# Altium project StarWars.PrjPcb
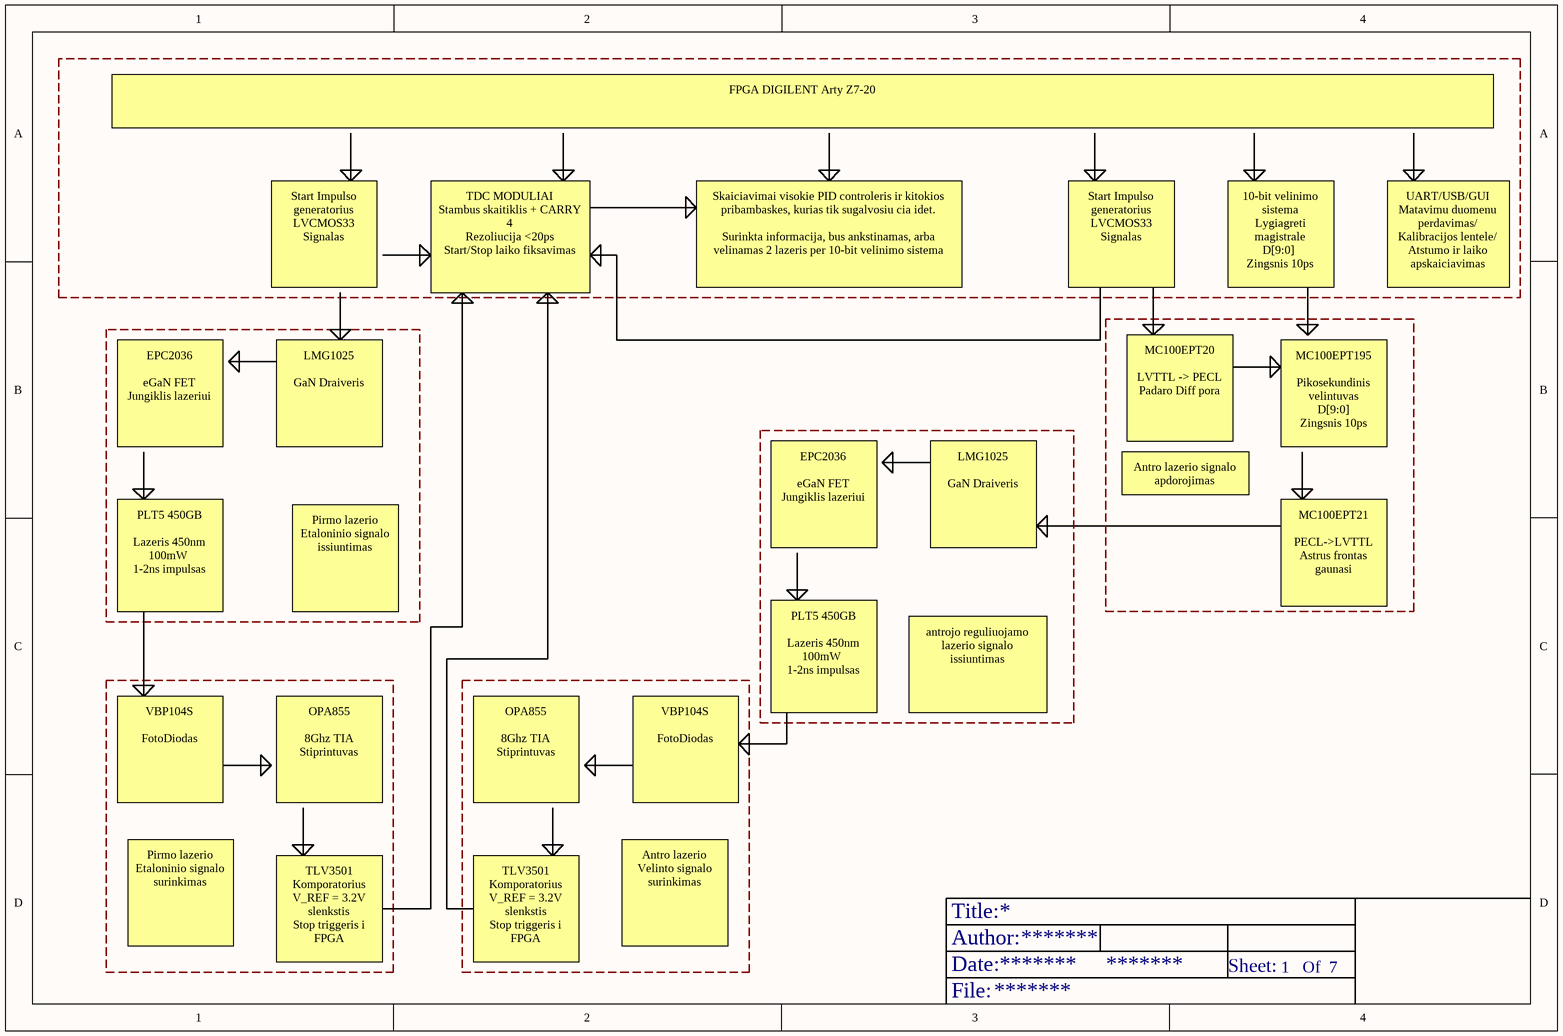
[diagram p0: Blokine diagrama.SchDoc]
7 sheets, 121 parts. Net scope: flat (ports and power ports of the same name join across sheets).
Board file: Prototype_REV1.PcbDoc
Sheets:
  Blokine diagrama.SchDoc
  Inputs_Outputs.SchDoc
  Power_Supply.SchDoc
  Time_Delay.SchDoc
  Laser_Driver.SchDoc
  Light_Detection.SchDoc
  Laser_System.SchDoc

## Sheet Blokine diagrama.SchDoc
size A4; Date: *******; ApprovedBy: *******; CheckedBy: None; Author: *******; CompanyName: *******; DrawnBy: Name; Engineer: *******; Organization: *******; Address1: *******; Address2: *******; Address3: *******; Address4: *******; DocumentNumber: Doc Num; Revision: *******; SheetNumber: 1; SheetTotal: 7; CurrentTime: *******; CurrentDate: *******; Time: *******; DocumentFullPathAndName: *******; DocumentName: *******; ModifiedDate: *******; ImagePath: *******; ProjectName: *******; Application_BuildNumber: *******

### Notes on the sheet
- FPGA DIGILENT Arty Z7-20
- Start Impulso generatorius
  LVCMOS33 Signalas
- TDC MODULIAI
  Stambus skaitiklis + CARRY 4
  Rezoliucija <20ps
  Start/Stop laiko fiksavimas
- Skaiciavimai visokie PID controleris ir kitokios pribambaskes, kurias tik sugalvosiu cia idet.
  Surinkta informacija, bus ankstinamas, arba velinamas 2 lazeris per 10-bit velinimo sistema
- 10-bit velinimo sistema
  Lygiagreti magistrale
  D[9:0]
  Zingsnis 10ps
- UART/USB/GUI
  Matavimu duomenu perdavimas/
  Kalibracijos lentele/
  Atstumo ir laiko apskaiciavimas
- EPC2036
  eGaN FET
  Jungiklis lazeriui
- LMG1025
  GaN Draiveris
- MC100EPT20
  LVTTL -> PECL
  Padaro Diff pora
- MC100EPT195
  Pikosekundinis velintuvas
  D[9:0]
  Zingsnis 10ps
- Antro lazerio signalo apdorojimas
- PLT5 450GB
  Lazeris 450nm
  100mW
  1-2ns impulsas
- Pirmo lazerio
  Etaloninio signalo issiuntimas
- MC100EPT21
  PECL->LVTTL
  Astrus frontas gaunasi
- antrojo reguliuojamo lazerio signalo issiuntimas
- VBP104S
  FotoDiodas
- OPA855
  8Ghz TIA Stiprintuvas
- Pirmo lazerio
  Etaloninio signalo surinkimas
- TLV3501
  Komporatorius
  V_REF = 3.2V slenkstis
  Stop triggeris i FPGA
- Antro lazerio
  Velinto signalo surinkimas
- Title:
- Date:
- Author:
- Sheet:
- Of
- File:

## Sheet Inputs_Outputs.SchDoc
size A4; Date: *******; ApprovedBy: *******; CheckedBy: None; Author: *******; CompanyName: *******; DrawnBy: Name; Engineer: *******; Organization: *******; Address1: *******; Address2: *******; Address3: *******; Address4: *******; DocumentNumber: Doc Num; Revision: *******; SheetNumber: 2; SheetTotal: 7; CurrentTime: *******; CurrentDate: *******; Time: *******; DocumentFullPathAndName: *******; DocumentName: *******; ModifiedDate: *******; ImagePath: *******; ProjectName: *******; Application_BuildNumber: *******
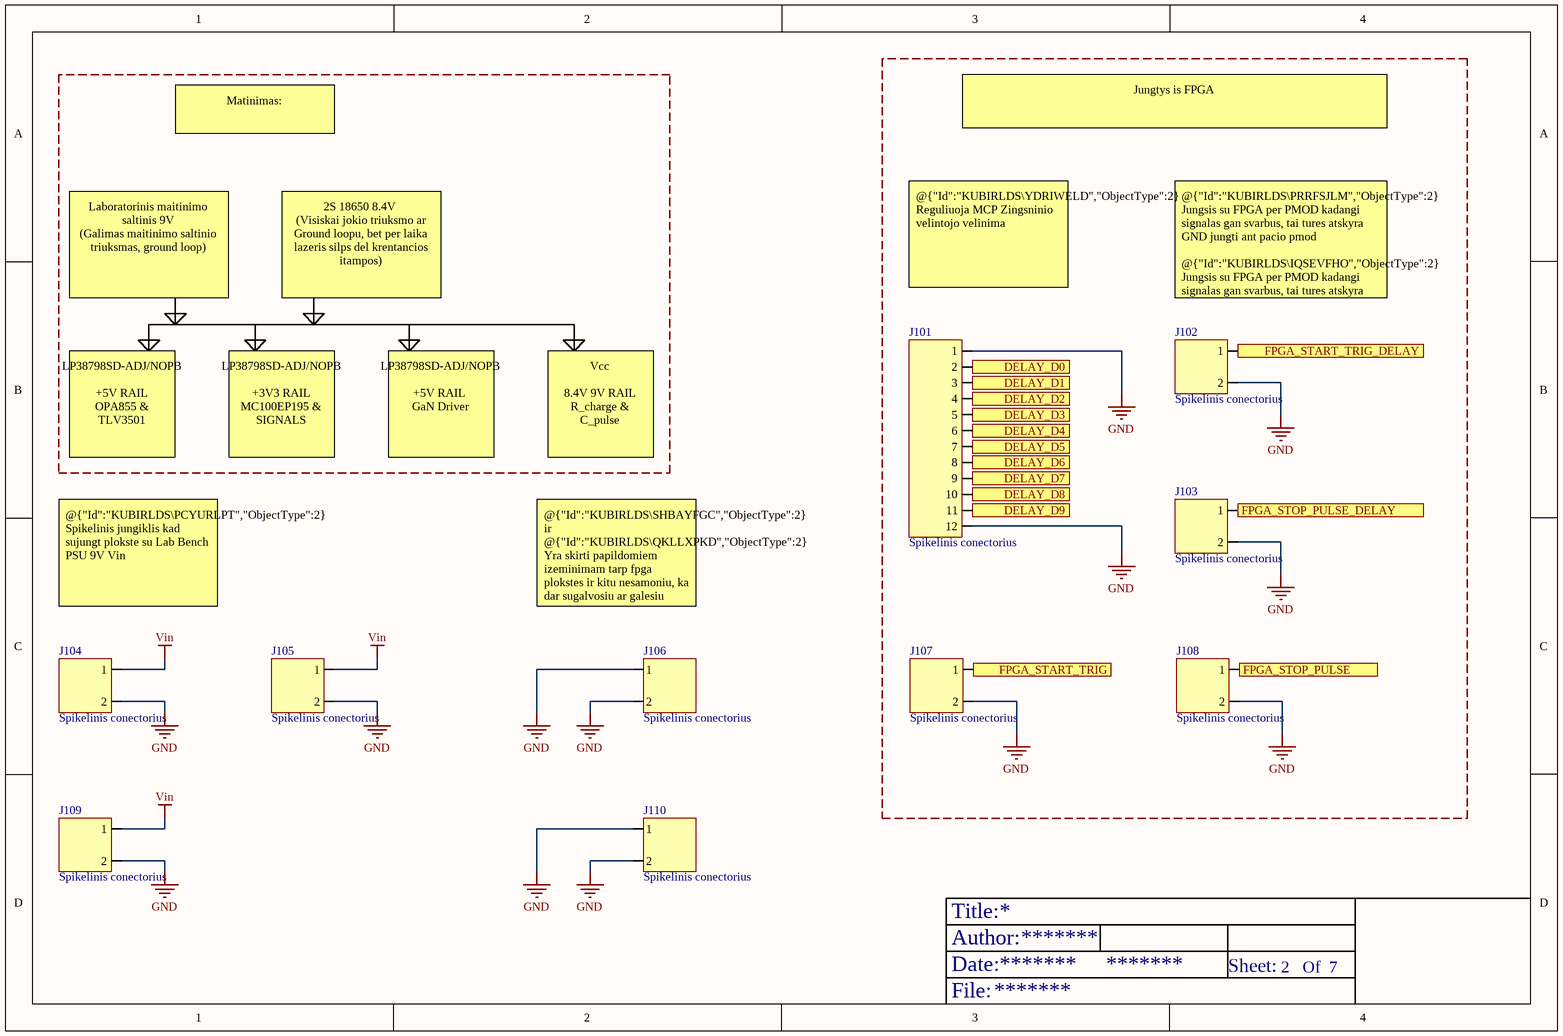
[diagram p1: Inputs_Outputs.SchDoc]

### Parts
J101  Spikelinis conectorius  [12pin header strip]
J102  Spikelinis conectorius  [2Pin header strip]
J103  Spikelinis conectorius  [2Pin header strip]
J104  Spikelinis conectorius  [2Pin header strip]
J105  Spikelinis conectorius  [2Pin header strip]
J106  Spikelinis conectorius  [2Pin header strip]
J107  Spikelinis conectorius  [2Pin header strip]
J108  Spikelinis conectorius  [2Pin header strip]
J109  Spikelinis conectorius  [2Pin header strip]
J110  Spikelinis conectorius  [2Pin header strip]

### Ports
DELAY_D0 (see Time_Delay[2B]), DELAY_D1 (see Time_Delay[2B]), DELAY_D2 (see Time_Delay[2B]), DELAY_D3 (see Time_Delay[2C]), DELAY_D4 (see Time_Delay[2C]), DELAY_D5 (see Time_Delay[2C]), DELAY_D6 (see Time_Delay[2C]), DELAY_D7 (see Time_Delay[2C]), DELAY_D8 (see Time_Delay[2C]), DELAY_D9 (see Time_Delay[2C]), FPGA_START_TRIG (see Laser_Driver[1C]), FPGA_START_TRIG_DELAY (see Time_Delay[1B]), FPGA_STOP_PULSE (see Light_Detection[4C]), FPGA_STOP_PULSE_DELAY (see Light_Detection[4B])

### Nets
GND: J101.1 J101.12 J102.2 J103.2 J104.2 J105.2 J106.1 J106.2 J107.2 J108.2 J109.2 J110.1 J110.2
Vin: J104.1 J105.1 J109.1
NetJ101_2: J101.2 ; port DELAY_D0
NetJ101_3: J101.3 ; port DELAY_D1
NetJ101_4: J101.4 ; port DELAY_D2
NetJ101_5: J101.5 ; port DELAY_D3
NetJ101_6: J101.6 ; port DELAY_D4
NetJ101_7: J101.7 ; port DELAY_D5
NetJ101_8: J101.8 ; port DELAY_D6
NetJ101_9: J101.9 ; port DELAY_D7
NetJ101_10: J101.10 ; port DELAY_D8
NetJ101_11: J101.11 ; port DELAY_D9
NetJ102_1: J102.1 ; port FPGA_START_TRIG_DELAY
NetJ103_1: J103.1 ; port FPGA_STOP_PULSE_DELAY
NetJ107_1: J107.1 ; port FPGA_START_TRIG
NetJ108_1: J108.1 ; port FPGA_STOP_PULSE

### Notes on the sheet
- Matinimas:
- Jungtys is FPGA
- Laboratorinis maitinimo saltinis 9V
  (Galimas maitinimo saltinio triuksmas, ground loop)
- 2S 18650 8.4V
  (Visiskai jokio triuksmo ar Ground loopu, bet per laika lazeris silps del krentancios itampos)
- @{"Id":"KUBIRLDS\YDRIWELD","ObjectType":2} Reguliuoja MCP Zingsninio velintojo velinima
- (near J102) @{"Id":"KUBIRLDS\PRRFSJLM","ObjectType":2} Jungsis su FPGA per PMOD kadangi signalas gan svarbus, tai tures atskyra GND jungti ant pacio pmod
  @{"Id":"KUBIRLDS\IQSEVFHO","ObjectType":2} Jungsis su FPGA per PMOD kadangi signalas gan svarbus, tai tures atskyra GND jungti ant pacio pmod
- LP38798SD-ADJ/NOPB
  +5V RAIL OPA855 & TLV3501
- LP38798SD-ADJ/NOPB
  +3V3 RAIL MC100EP195 & SIGNALS
- LP38798SD-ADJ/NOPB
  +5V RAIL
  GaN Driver
- Vcc
  8.4V 9V RAIL
  R_charge & C_pulse
- @{"Id":"KUBIRLDS\PCYURLPT","ObjectType":2} Spikelinis jungiklis kad sujungt plokste su Lab Bench PSU 9V Vin
- @{"Id":"KUBIRLDS\SHBAYFGC","ObjectType":2} ir @{"Id":"KUBIRLDS\QKLLXPKD","ObjectType":2} Yra skirti papildomiem izeminimam tarp fpga plokstes ir kitu nesamoniu, ka dar sugalvosiu ar galesiu izemint
- Title:
- Date:
- Author:
- Sheet:
- Of
- File:

### Library data of the parts
J101 = 12PinConnector: TSW-112-07-G-S
J102-J110 = 2PinConnector

## Sheet Power_Supply.SchDoc
size A4; Date: *******; ApprovedBy: *******; CheckedBy: None; Author: *******; CompanyName: *******; DrawnBy: Name; Engineer: *******; Organization: *******; Address1: *******; Address2: *******; Address3: *******; Address4: *******; DocumentNumber: Doc Num; Revision: *******; SheetNumber: 3; SheetTotal: 7; CurrentTime: *******; CurrentDate: *******; Time: *******; DocumentFullPathAndName: *******; DocumentName: *******; ModifiedDate: *******; ImagePath: *******; ProjectName: *******; Application_BuildNumber: *******
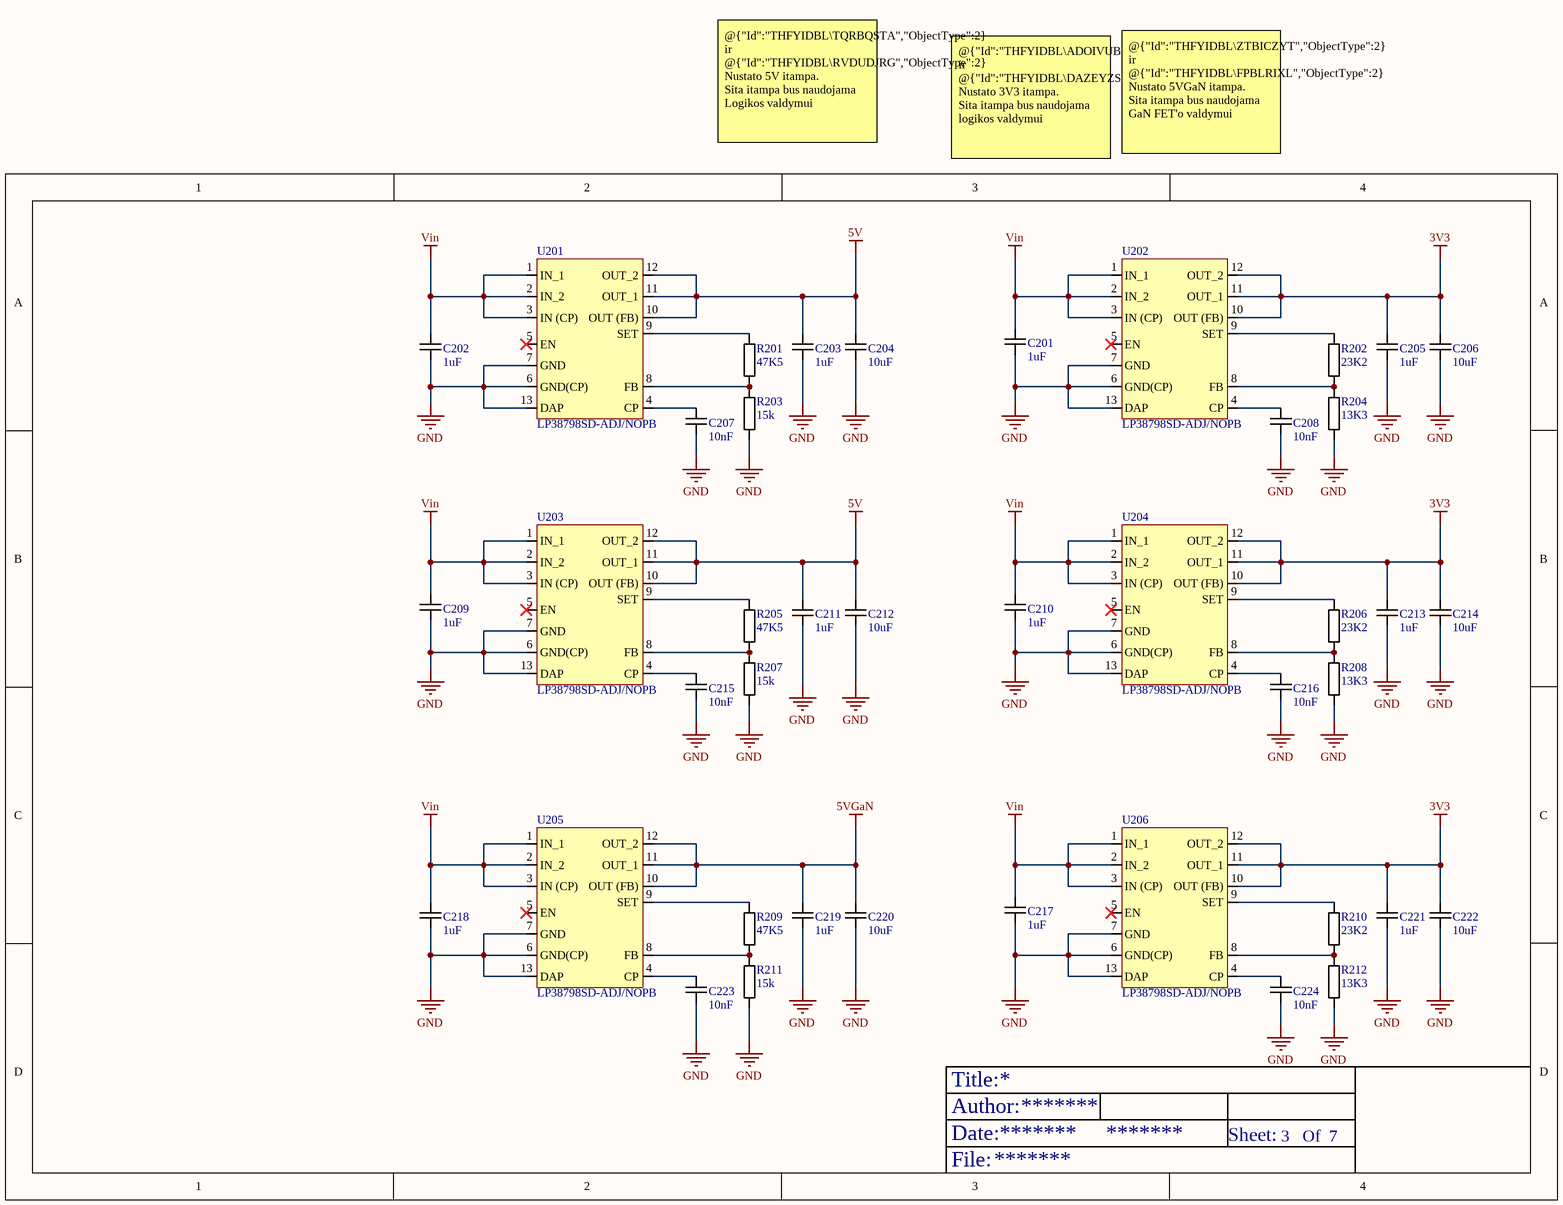
[diagram p2: Power_Supply.SchDoc]

### Parts
C201  1uF  [1uF 0603]
C202  1uF  [1uF 0603]
C203  1uF  [1uF 0603]
C204  10uF  [10uF 0805]
C205  1uF  [1uF 0603]
C206  10uF  [10uF 0805]
C207  10nF  [10nF 0402]
C208  10nF  [10nF 0402]
C209  1uF  [1uF 0603]
C210  1uF  [1uF 0603]
C211  1uF  [1uF 0603]
C212  10uF  [10uF 0805]
C213  1uF  [1uF 0603]
C214  10uF  [10uF 0805]
C215  10nF  [10nF 0402]
C216  10nF  [10nF 0402]
C217  1uF  [1uF 0603]
C218  1uF  [1uF 0603]
C219  1uF  [1uF 0603]
C220  10uF  [10uF 0805]
C221  1uF  [1uF 0603]
C222  10uF  [10uF 0805]
C223  10nF  [10nF 0402]
C224  10nF  [10nF 0402]
R201  47K5  [47.5k 0402]
R202  23K2  [23.2k 0402]
R203  15k  [15k 0402]
R204  13K3  [13k3 0402]
R205  47K5  [47.5k 0402]
R206  23K2  [23.2k 0402]
R207  15k  [15k 0402]
R208  13K3  [13k3 0402]
R209  47K5  [47.5k 0402]
R210  23K2  [23.2k 0402]
R211  15k  [15k 0402]
R212  13K3  [13k3 0402]
U201  LP38798SD-ADJ/NOPB  [LP38798SD-ADJ/NOPB]
U202  LP38798SD-ADJ/NOPB  [LP38798SD-ADJ/NOPB]
U203  LP38798SD-ADJ/NOPB  [LP38798SD-ADJ/NOPB]
U204  LP38798SD-ADJ/NOPB  [LP38798SD-ADJ/NOPB]
U205  LP38798SD-ADJ/NOPB  [LP38798SD-ADJ/NOPB]
U206  LP38798SD-ADJ/NOPB  [LP38798SD-ADJ/NOPB]

### Nets
3V3: C205.2 C206.2 C213.2 C214.2 C221.2 C222.2 U202.10(OUT_(FB)) U202.11(OUT_1) U202.12(OUT_2) U204.10(OUT_(FB)) U204.11(OUT_1) U204.12(OUT_2) U206.10(OUT_(FB)) U206.11(OUT_1) U206.12(OUT_2)
5V: C203.2 C204.2 C211.2 C212.2 U201.10(OUT_(FB)) U201.11(OUT_1) U201.12(OUT_2) U203.10(OUT_(FB)) U203.11(OUT_1) U203.12(OUT_2)
5VGaN: C219.2 C220.2 U205.10(OUT_(FB)) U205.11(OUT_1) U205.12(OUT_2)
GND: C201.1 C202.1 C203.1 C204.1 C205.1 C206.1 C207.1 C208.1 C209.1 C210.1 C211.1 C212.1 C213.1 C214.1 C215.1 C216.1 C217.1 C218.1 C219.1 C220.1 C221.1 C222.1 C223.1 C224.1 R203.1 R204.1 R207.1 R208.1 R211.1 R212.1 U201.6(GND(CP)) U201.7(GND) U201.13(DAP) U202.6(GND(CP)) U202.7(GND) U202.13(DAP) U203.6(GND(CP)) U203.7(GND) U203.13(DAP) U204.6(GND(CP)) U204.7(GND) U204.13(DAP) U205.6(GND(CP)) U205.7(GND) U205.13(DAP) U206.6(GND(CP)) U206.7(GND) U206.13(DAP)
Vin: C201.2 C202.2 C209.2 C210.2 C217.2 C218.2 U201.1(IN_1) U201.2(IN_2) U201.3(IN_(CP)) U202.1(IN_1) U202.2(IN_2) U202.3(IN_(CP)) U203.1(IN_1) U203.2(IN_2) U203.3(IN_(CP)) U204.1(IN_1) U204.2(IN_2) U204.3(IN_(CP)) U205.1(IN_1) U205.2(IN_2) U205.3(IN_(CP)) U206.1(IN_1) U206.2(IN_2) U206.3(IN_(CP))
NetC207_2: C207.2 U201.4(CP)
NetC208_2: C208.2 U202.4(CP)
NetC215_2: C215.2 U203.4(CP)
NetC216_2: C216.2 U204.4(CP)
NetC223_2: C223.2 U205.4(CP)
NetC224_2: C224.2 U206.4(CP)
NetR201_1: R201.1 R203.2 U201.8(FB)
NetR201_2: R201.2 U201.9(SET)
NetR202_1: R202.1 U202.9(SET)
NetR202_2: R202.2 R204.2 U202.8(FB)
NetR205_1: R205.1 R207.2 U203.8(FB)
NetR205_2: R205.2 U203.9(SET)
NetR206_1: R206.1 U204.9(SET)
NetR206_2: R206.2 R208.2 U204.8(FB)
NetR209_1: R209.1 R211.2 U205.8(FB)
NetR209_2: R209.2 U205.9(SET)
NetR210_1: R210.1 U206.9(SET)
NetR210_2: R210.2 R212.2 U206.8(FB)

Not connected (* = marked no-connect by the designer): U201 5(EN)*; U202 5(EN)*; U203 5(EN)*; U204 5(EN)*; U205 5(EN)*; U206 5(EN)*

### Notes on the sheet
- @{"Id":"THFYIDBL\TQRBQSTA","ObjectType":2} ir @{"Id":"THFYIDBL\RVDUDJRG","ObjectType":2} Nustato 5V itampa.
  Sita itampa bus naudojama Logikos valdymui
- @{"Id":"THFYIDBL\ZTBICZYT","ObjectType":2} ir @{"Id":"THFYIDBL\FPBLRIXL","ObjectType":2} Nustato 5VGaN itampa.
  Sita itampa bus naudojama GaN FET'o valdymui
- @{"Id":"THFYIDBL\ADOIVUBA","ObjectType":2} ir @{"Id":"THFYIDBL\DAZEYZSS","ObjectType":2} Nustato 3V3 itampa.
  Sita itampa bus naudojama logikos valdymui
- Title:
- Date:
- Author:
- Sheet:
- Of
- File:

### Library data of the parts
C201-C203 C205 C209-C211 C213 C217-C219 C221 = 1uF 0603: CGA3E1X7R1E105K080AC
C204 C206 C212 C214 C220 C222 = 10uF 0805: GRJ21BR61E106KE01K
C207 C208 C215 C216 C223 C224 = 10nF 0402: C0402C103J5RACTU
R201 R205 R209 = 47K5 0402: CR0402-FX-4752GLF
R202 R206 R210 = 23K2 0402: CR0402-FX-2322GLF
R203 R207 R211 = 15k 0402: CRCW040215K0FKED
R204 R208 R212 = 13K3 0402: CRCW040213K3FKED
U201-U206 = LP38798SD-ADJ/NOPB: input 3-20V output 1.5-5V

## Sheet Time_Delay.SchDoc
size A4; Date: *******; ApprovedBy: *******; CheckedBy: None; Author: *******; CompanyName: *******; DrawnBy: Name; Engineer: *******; Organization: *******; Address1: *******; Address2: *******; Address3: *******; Address4: *******; DocumentNumber: Doc Num; Revision: *******; SheetNumber: 4; SheetTotal: 7; CurrentTime: *******; CurrentDate: *******; Time: *******; DocumentFullPathAndName: *******; DocumentName: *******; ModifiedDate: *******; ImagePath: *******; ProjectName: *******; Application_BuildNumber: *******
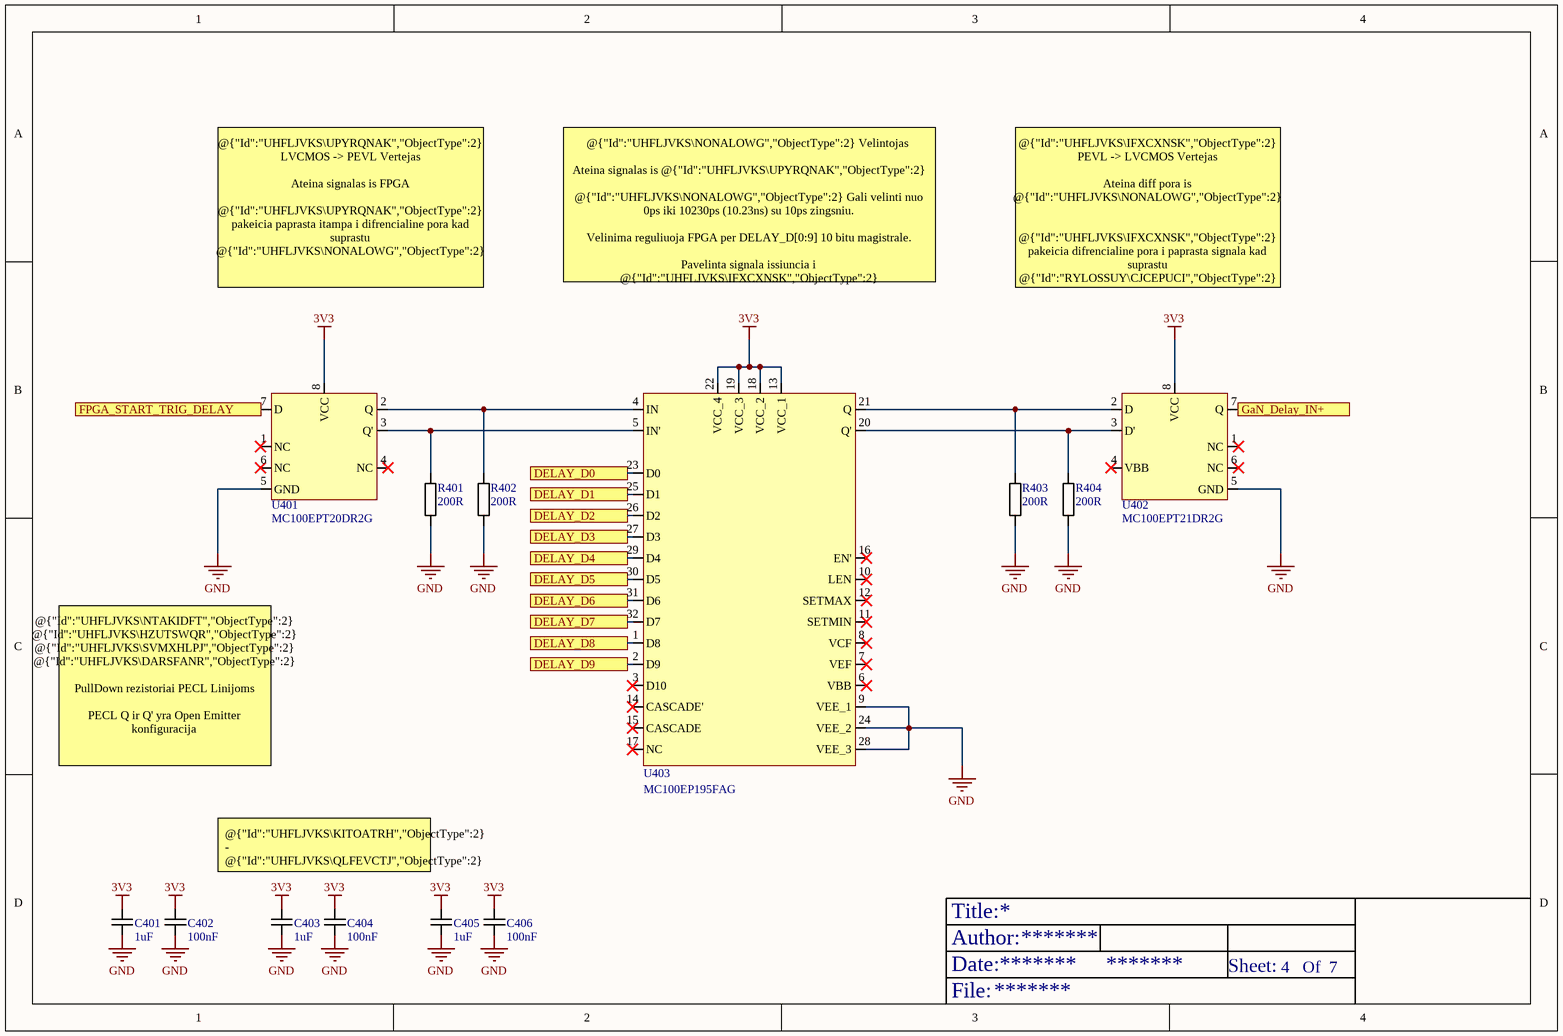
[diagram p3: Time_Delay.SchDoc]

### Parts
C401  1uF  [1uF 0603]
C402  100nF  [100nF 0402]
C403  1uF  [1uF 0603]
C404  100nF  [100nF 0402]
C405  1uF  [1uF 0603]
C406  100nF  [100nF 0402]
R401  200R  [200R 0402]
R402  200R  [200R 0402]
R403  200R  [200R 0402]
R404  200R  [200R 0402]
U401  MC100EPT20DR2G  [MC100EPT20DR2G]
U402  MC100EPT21DR2G  [MC100EPT21DR2G]
U403  MC100EP195FAG  [MC100EP195FAG]

### Ports
DELAY_D0 (see Inputs_Outputs[3B]), DELAY_D1 (see Inputs_Outputs[3B]), DELAY_D2 (see Inputs_Outputs[3B]), DELAY_D3 (see Inputs_Outputs[3B]), DELAY_D4 (see Inputs_Outputs[3B]), DELAY_D5 (see Inputs_Outputs[3B]), DELAY_D6 (see Inputs_Outputs[3B]), DELAY_D7 (see Inputs_Outputs[3B]), DELAY_D8 (see Inputs_Outputs[3B]), DELAY_D9 (see Inputs_Outputs[3B]), FPGA_START_TRIG_DELAY (see Inputs_Outputs[4B]), GaN_Delay_IN+ (see Laser_Driver[1B])

### Nets
3V3: C401.2 C402.2 C403.2 C404.2 C405.2 C406.2 U401.8(VCC) U402.8(VCC) U403.13(VCC_1) U403.18(VCC_2) U403.19(VCC_3) U403.22(VCC_4)
GND: C401.1 C402.1 C403.1 C404.1 C405.1 C406.1 R401.1 R402.1 R403.1 R404.1 U401.5(GND) U402.5(GND) U403.9(VEE_1) U403.24(VEE_2) U403.28(VEE_3)
NetJ101_2: U403.23(D0) ; port DELAY_D0
NetJ101_3: U403.25(D1) ; port DELAY_D1
NetJ101_4: U403.26(D2) ; port DELAY_D2
NetJ101_5: U403.27(D3) ; port DELAY_D3
NetJ101_6: U403.29(D4) ; port DELAY_D4
NetJ101_7: U403.30(D5) ; port DELAY_D5
NetJ101_8: U403.31(D6) ; port DELAY_D6
NetJ101_9: U403.32(D7) ; port DELAY_D7
NetJ101_10: U403.1(D8) ; port DELAY_D8
NetJ101_11: U403.2(D9) ; port DELAY_D9
NetJ102_1: U401.7(D) ; port FPGA_START_TRIG_DELAY
NetR302_2: U402.7(Q) ; port GaN_Delay_IN+
NetR401_2: R401.2 U401.3(Q') U403.5(IN')
NetR402_2: R402.2 U401.2(Q) U403.4(IN)
NetR403_2: R403.2 U402.2(D) U403.21(Q)
NetR404_2: R404.2 U402.3(D') U403.20(Q')

Not connected (* = marked no-connect by the designer): U401 1(NC)* 4(NC)* 6(NC)*; U402 1(NC)* 4(VBB)* 6(NC)*; U403 3(D10)* 6(VBB)* 7(VEF)* 8(VCF)* 10(LEN)* 11(SETMIN)* 12(SETMAX)* 14(CASCADE')* 15(CASCADE)* 16(EN')* 17(NC)*

### Notes on the sheet
- @{"Id":"UHFLJVKS\UPYRQNAK","ObjectType":2} LVCMOS -> PEVL Vertejas
  Ateina signalas is FPGA
  @{"Id":"UHFLJVKS\UPYRQNAK","ObjectType":2} pakeicia paprasta itampa i difrencialine pora kad suprastu @{"Id":"UHFLJVKS\NONALOWG","ObjectType":2}
- @{"Id":"UHFLJVKS\NONALOWG","ObjectType":2} Velintojas
  Ateina signalas is @{"Id":"UHFLJVKS\UPYRQNAK","ObjectType":2}
  @{"Id":"UHFLJVKS\NONALOWG","ObjectType":2} Gali velinti nuo 0ps iki 10230ps (10.23ns) su 10ps zingsniu.
  Velinima reguliuoja FPGA per DELAY_D[0:9] 10 bitu magistrale.
  Pavelinta signala issiuncia i @{"Id":"UHFLJVKS\IFXCXNSK","ObjectType":2}
- @{"Id":"UHFLJVKS\IFXCXNSK","ObjectType":2} PEVL -> LVCMOS Vertejas
  Ateina diff pora is @{"Id":"UHFLJVKS\NONALOWG","ObjectType":2}
  @{"Id":"UHFLJVKS\IFXCXNSK","ObjectType":2} pakeicia difrencialine pora i paprasta signala kad suprastu @{"Id":"RYLOSSUY\CJCEPUCI","ObjectType":2}
- @{"Id":"UHFLJVKS\NTAKIDFT","ObjectType":2} @{"Id":"UHFLJVKS\HZUTSWQR","ObjectType":2} @{"Id":"UHFLJVKS\SVMXHLPJ","ObjectType":2} @{"Id":"UHFLJVKS\DARSFANR","ObjectType":2}
  PullDown rezistoriai PECL Linijoms
  PECL Q ir Q' yra Open Emitter konfiguracija
- @{"Id":"UHFLJVKS\KITOATRH","ObjectType":2} - @{"Id":"UHFLJVKS\QLFEVCTJ","ObjectType":2}
  Bus prie @{"Id":"UHFLJVKS\UPYRQNAK","ObjectType":2} - @{"Id":"UHFLJVKS\NONALOWG","ObjectType":2} Iejimu
- Title:
- Date:
- Author:
- Sheet:
- Of
- File:

### Library data of the parts
C401 C403 C405 = 1uF 0603: CGA3E1X7R1E105K080AC
C402 C404 C406 = 100n 0402: C1005X7R1E104K050BB
R401-R404 = 200R 0402: ERA-2AED201X

## Sheet Laser_Driver.SchDoc
size A4; Date: *******; ApprovedBy: *******; CheckedBy: None; Author: *******; CompanyName: *******; DrawnBy: Name; Engineer: *******; Organization: *******; Address1: *******; Address2: *******; Address3: *******; Address4: *******; DocumentNumber: Doc Num; Revision: *******; SheetNumber: 5; SheetTotal: 7; CurrentTime: *******; CurrentDate: *******; Time: *******; DocumentFullPathAndName: *******; DocumentName: *******; ModifiedDate: *******; ImagePath: *******; ProjectName: *******; Application_BuildNumber: *******
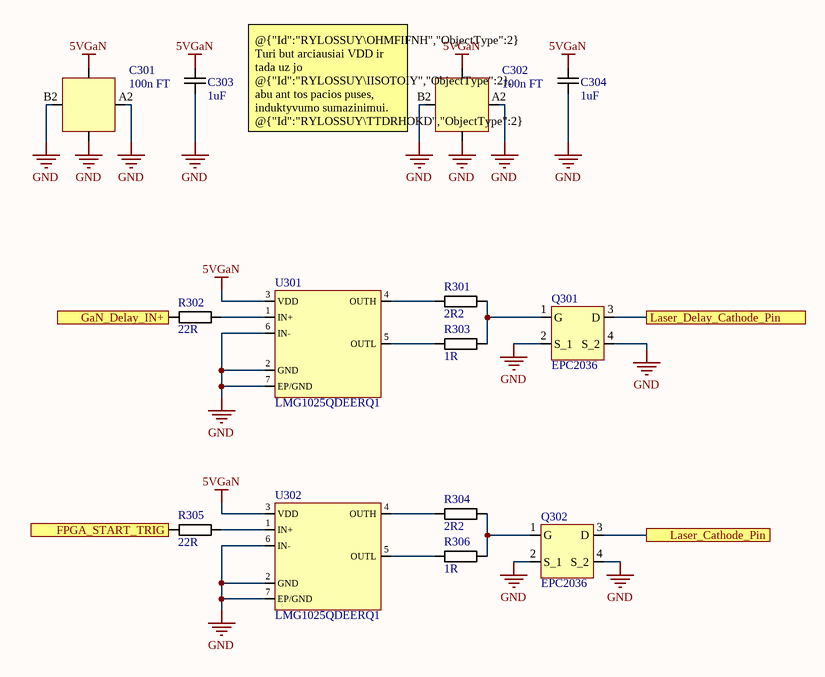
[diagram p4: Laser_Driver.SchDoc]

### Parts
C301  100n FT  [100n FT 0603]
C302  100n FT  [100n FT 0603]
C303  1uF  [1uF 0603]
C304  1uF  [1uF 0603]
Q301  EPC2036  [EPC2036]
Q302  EPC2036  [EPC2036]
R301  2R2  [2R2 0402]
R302  22R  [22R 0402]
R303  1R  [1R 0402]
R304  2R2  [2R2 0402]
R305  22R  [22R 0402]
R306  1R  [1R 0402]
U301  LMG1025QDEERQ1  [LMG1025QDEERQ1]
U302  LMG1025QDEERQ1  [LMG1025QDEERQ1]

### Ports
FPGA_START_TRIG (see Inputs_Outputs[3C]), GaN_Delay_IN+ (see Time_Delay[4B]), Laser_Cathode_Pin (see Laser_System[1C]), Laser_Delay_Cathode_Pin (see Laser_System[1B])

### Nets
5VGaN: C301.3(OUTPUT) C302.3(OUTPUT) C303.2 C304.2 U301.3(VDD) U302.3(VDD)
GND: C301.1(INPUT) C301.A2(GND_1) C301.B2(GND_2) C302.1(INPUT) C302.A2(GND_1) C302.B2(GND_2) C303.1 C304.1 Q301.2(S_1) Q301.4(S_2) Q302.2(S_1) Q302.4(S_2) U301.2(GND) U301.6(IN-) U301.7(EP/GND) U302.2(GND) U302.6(IN-) U302.7(EP/GND)
NetD601_3: Q301.3(D) ; port Laser_Delay_Cathode_Pin
NetD603_3: Q302.3(D) ; port Laser_Cathode_Pin
NetJ107_1: R305.2 ; port FPGA_START_TRIG
NetQ301_1: Q301.1(G) R301.2 R303.2
NetQ302_1: Q302.1(G) R304.2 R306.2
NetR301_1: R301.1 U301.4(OUTH)
NetR302_1: R302.1 U301.1(IN+)
NetR302_2: R302.2 ; port GaN_Delay_IN+
NetR303_1: R303.1 U301.5(OUTL)
NetR304_1: R304.1 U302.4(OUTH)
NetR305_1: R305.1 U302.1(IN+)
NetR306_1: R306.1 U302.5(OUTL)

### Notes on the sheet
- (near C302) @{"Id":"RYLOSSUY\OHMFIFNH","ObjectType":2} Turi but arciausiai VDD ir tada uz jo @{"Id":"RYLOSSUY\IISOTOIY","ObjectType":2}, abu ant tos pacios puses, induktyvumo sumazinimui.
  @{"Id":"RYLOSSUY\TTDRHOKD","ObjectType":2} Slopina visokius nepageidaujemus signalus
- Title:
- Date:
- Author:
- Sheet:
- Of
- File:

### Library data of the parts
C301 C302 = 100n 0603 FT: NFM18PC104R1C3D
C303 C304 = 1uF 0603: CGA3E1X7R1E105K080AC
R301 R304 = 2R2 0402: CRT0402-FZ-2R00GLF
R302 R305 = 22R 0402: ERA-2AKD220X
R303 R306 = 1R 0402: CRT0402-FZ-1R00GLF
U301 U302 = LMG1025QDEERQ1: GaN Driver

## Sheet Light_Detection.SchDoc
size A4; Date: *******; ApprovedBy: *******; CheckedBy: None; Author: *******; CompanyName: *******; DrawnBy: Name; Engineer: *******; Organization: *******; Address1: *******; Address2: *******; Address3: *******; Address4: *******; DocumentNumber: Doc Num; Revision: *******; SheetNumber: 6; SheetTotal: 7; CurrentTime: *******; CurrentDate: *******; Time: *******; DocumentFullPathAndName: *******; DocumentName: *******; ModifiedDate: *******; ImagePath: *******; ProjectName: *******; Application_BuildNumber: *******
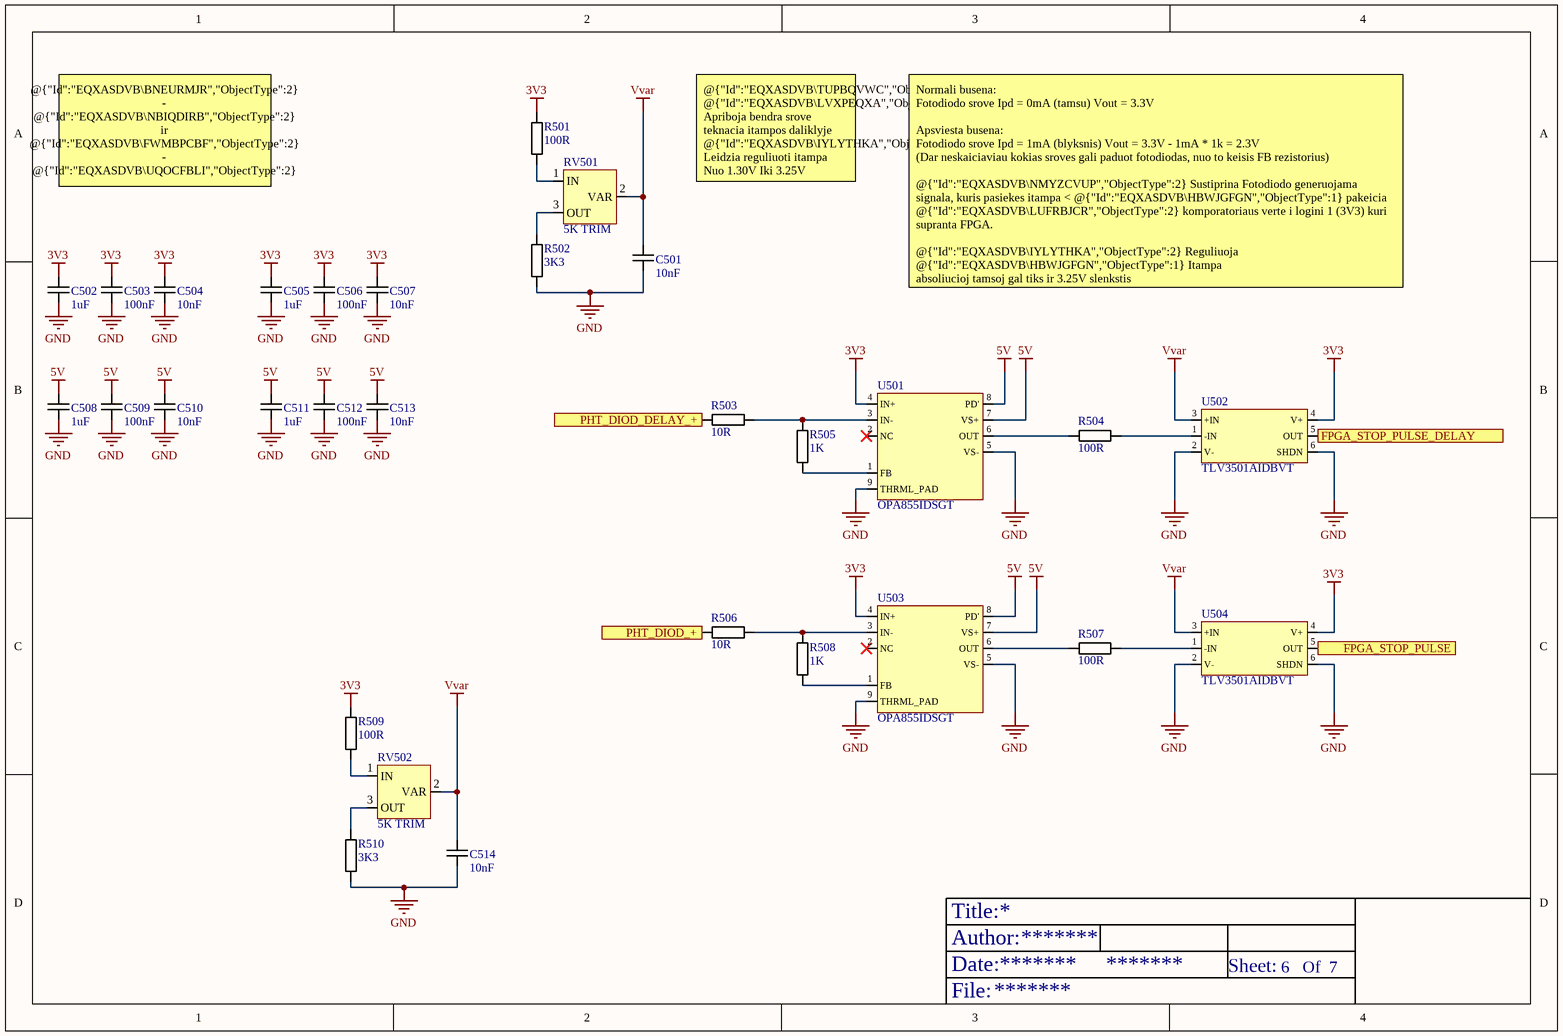
[diagram p5: Light_Detection.SchDoc]

### Parts
C501  10nF  [10nF 0402]
C502  1uF  [1uF 0603]
C503  100nF  [100nF 0402]
C504  10nF  [10nF 0402]
C505  1uF  [1uF 0603]
C506  100nF  [100nF 0402]
C507  10nF  [10nF 0402]
C508  1uF  [1uF 0603]
C509  100nF  [100nF 0402]
C510  10nF  [10nF 0402]
C511  1uF  [1uF 0603]
C512  100nF  [100nF 0402]
C513  10nF  [10nF 0402]
C514  10nF  [10nF 0402]
R501  100R  [100R 0402]
R502  3K3  [3k3 0402]
R503  10R  [10R 0402]
R504  100R  [100R 0402]
R505  1K  [1k 0603]
R506  10R  [10R 0402]
R507  100R  [100R 0402]
R508  1K  [1k 0603]
R509  100R  [100R 0402]
R510  3K3  [3k3 0402]
RV501  5K TRIM  [5K TRIM]
RV502  5K TRIM  [5K TRIM]
U501  OPA855IDSGT  [OPA855IDSGT]
U502  TLV3501AIDBVT  [TLV3501AIDBVT]
U503  OPA855IDSGT  [OPA855IDSGT]
U504  TLV3501AIDBVT  [TLV3501AIDBVT]

### Ports
FPGA_STOP_PULSE (see Inputs_Outputs[4C]), FPGA_STOP_PULSE_DELAY (see Inputs_Outputs[4B]), PHT_DIOD_+ (see Laser_System[3C]), PHT_DIOD_DELAY_+ (see Laser_System[3B])

### Nets
3V3: C502.2 C503.2 C504.2 C505.2 C506.2 C507.2 R501.1 R509.1 U501.4(IN+) U502.4(V+) U503.4(IN+) U504.4(V+)
5V: C508.2 C509.2 C510.2 C511.2 C512.2 C513.2 U501.7(VS+) U501.8(PD') U503.7(VS+) U503.8(PD')
GND: C501.1 C502.1 C503.1 C504.1 C505.1 C506.1 C507.1 C508.1 C509.1 C510.1 C511.1 C512.1 C513.1 C514.1 R502.2 R510.2 U501.5(VS-) U501.9(THRML_PAD) U502.2(V-) U502.6(SHDN) U503.5(VS-) U503.9(THRML_PAD) U504.2(V-) U504.6(SHDN)
Vvar: C501.2 C514.2 RV501.2(VAR) RV502.2(VAR) U502.3(+IN) U504.3(+IN)
NetD602_1: R503.1 ; port PHT_DIOD_DELAY_+
NetD604_1: R506.1 ; port PHT_DIOD_+
NetJ103_1: U502.5(OUT) ; port FPGA_STOP_PULSE_DELAY
NetJ108_1: U504.5(OUT) ; port FPGA_STOP_PULSE
NetR501_2: R501.2 RV501.1(IN)
NetR502_1: R502.1 RV501.3(OUT)
NetR503_2: R503.2 R505.1 U501.3(IN-)
NetR504_1: R504.1 U501.6(OUT)
NetR504_2: R504.2 U502.1(-IN)
NetR505_2: R505.2 U501.1(FB)
NetR506_2: R506.2 R508.1 U503.3(IN-)
NetR507_1: R507.1 U503.6(OUT)
NetR507_2: R507.2 U504.1(-IN)
NetR508_2: R508.2 U503.1(FB)
NetR509_2: R509.2 RV502.1(IN)
NetR510_1: R510.1 RV502.3(OUT)

Not connected (* = marked no-connect by the designer): U501 2(NC)*; U503 2(NC)*

### Notes on the sheet
- @{"Id":"EQXASDVB\BNEURMJR","ObjectType":2} - @{"Id":"EQXASDVB\NBIQDIRB","ObjectType":2} ir @{"Id":"EQXASDVB\FWMBPCBF","ObjectType":2} - @{"Id":"EQXASDVB\UQOCFBLI","ObjectType":2}
  Reikalingi filtravimui, bei stabilios itampos islaikymui.
  Kiekviena eile kondensatoriu lituojasi kuo arciau mikruskes
  @{"Id":"EQXASDVB\NMYZCVUP","ObjectType":2} - @{"Id":"EQXASDVB\AOQOIBQK","ObjectType":2}
- @{"Id":"EQXASDVB\TUPBQVWC","ObjectType":2} @{"Id":"EQXASDVB\LVXPEQXA","ObjectType":2} Apriboja bendra srove teknacia itampos daliklyje
  @{"Id":"EQXASDVB\IYLYTHKA","ObjectType":2} Leidzia reguliuoti itampa
  Nuo 1.30V Iki 3.25V
- Normali busena:
  Fotodiodo srove Ipd = 0mA (tamsu) Vout = 3.3V
  Apsviesta busena:
  Fotodiodo srove Ipd = 1mA (blyksnis) Vout = 3.3V - 1mA * 1k = 2.3V
  (Dar neskaiciaviau kokias sroves gali paduot fotodiodas, nuo to keisis FB rezistorius)
  @{"Id":"EQXASDVB\NMYZCVUP","ObjectType":2} Sustiprina Fotodiodo generuojama signala, kuris pasiekes itampa < @{"Id":"EQXASDVB\HBWJGFGN","ObjectType":1} pakeicia @{"Id":"EQXASDVB\LUFRBJCR","ObjectType":2} komporatoriaus verte i logini 1 (3V3) kuri supranta FPGA.
  @{"Id":"EQXASDVB\IYLYTHKA","ObjectType":2} Reguliuoja @{"Id":"EQXASDVB\HBWJGFGN","ObjectType":1} Itampa
  absoliucioj tamsoj gal tiks ir 3.25V slenkstis
  Apsviestam kambari gali but reikes ir 1.30V slenkscio
- Title:
- Date:
- Author:
- Sheet:
- Of
- File:

### Library data of the parts
C501 C504 C507 C510 C513 C514 = 10nF 0402: C0402C103J5RACTU
C502 C505 C508 C511 = 1uF 0603: CGA3E1X7R1E105K080AC
C503 C506 C509 C512 = 100n 0402: C1005X7R1E104K050BB
R501 R504 R507 R509 = 100R 0402: ERA-2VEB1000X
R502 R510 = 3K3 0402: ERJ-U02F3301X
R503 R506 = 10R 0402: CRT0402-DZ-10R0GLF
R505 R508 = 1K 0603: ERA-3AEB102V
RV501 RV502 = 5K TRIM: 3314G-1-502E
U501 U503 = OPA855IDSGT: OP ampas
U502 U504 = TLV3501AIDBVT: Comparatorius

## Sheet Laser_System.SchDoc
size A4; Date: *******; ApprovedBy: *******; CheckedBy: None; Author: *******; CompanyName: *******; DrawnBy: Name; Engineer: *******; Organization: *******; Address1: *******; Address2: *******; Address3: *******; Address4: *******; DocumentNumber: Doc Num; Revision: *******; SheetNumber: 7; SheetTotal: 7; CurrentTime: *******; CurrentDate: *******; Time: *******; DocumentFullPathAndName: *******; DocumentName: *******; ModifiedDate: *******; ImagePath: *******; ProjectName: *******; Application_BuildNumber: *******
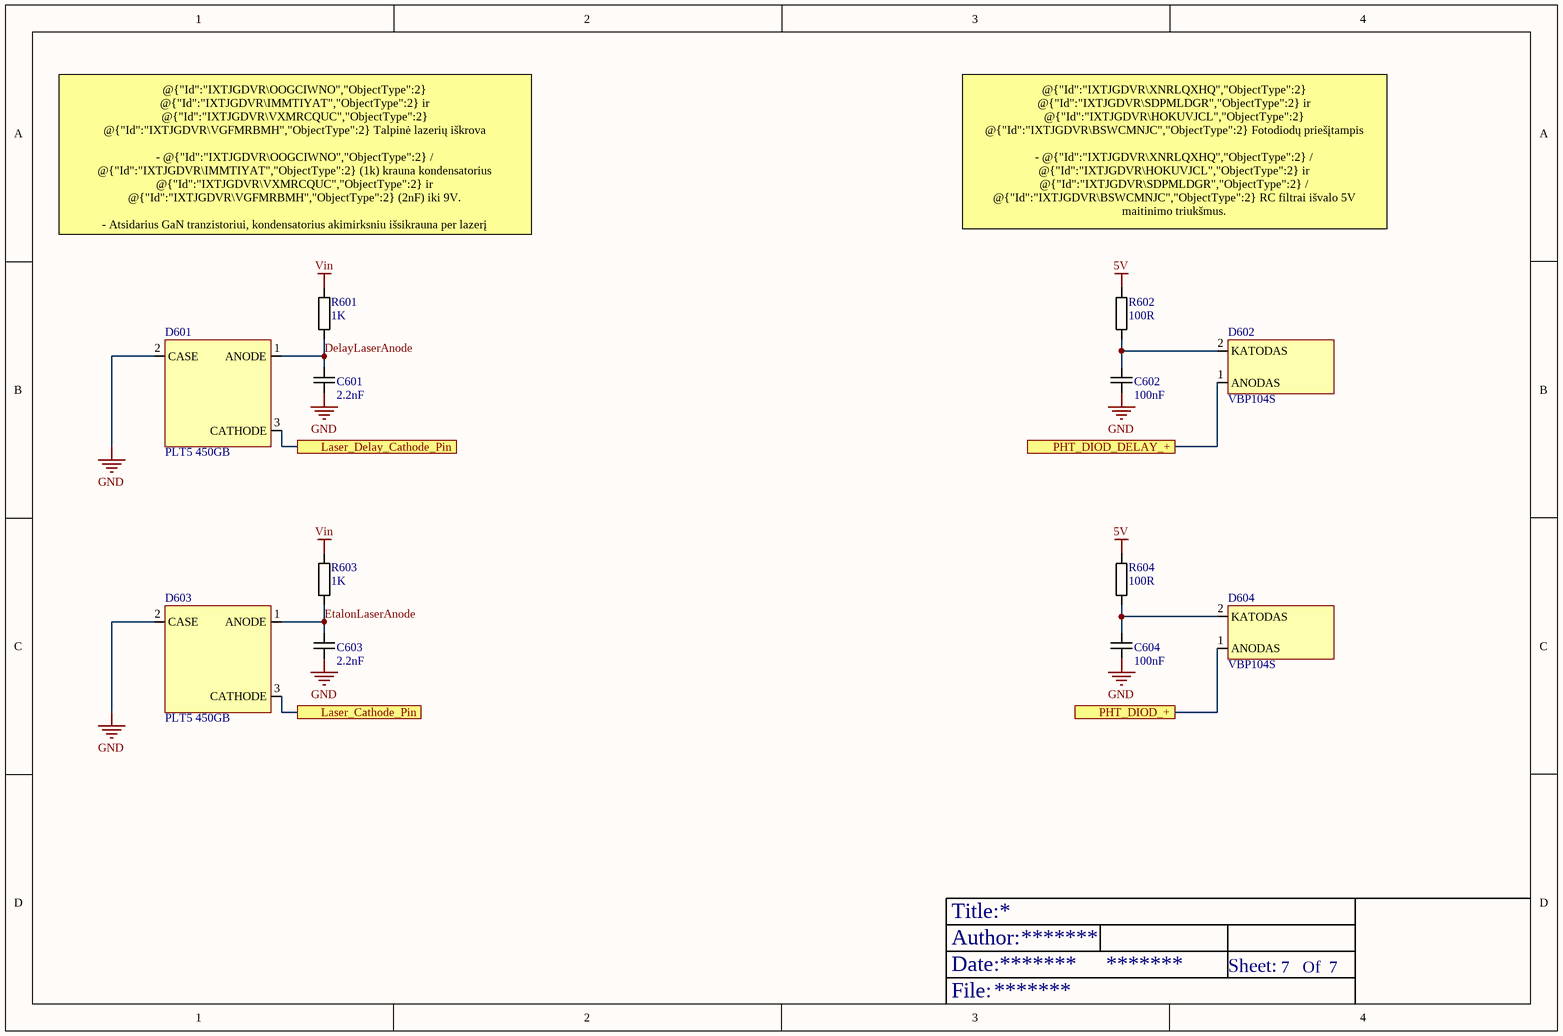
[diagram p6: Laser_System.SchDoc]

### Parts
C601  2.2nF  [2.2nF 0603]
C602  100nF  [100nF 0402]
C603  2.2nF  [2.2nF 0603]
C604  100nF  [100nF 0402]
D601  PLT5 450GB  [PLT5 450GB]
D602  VBP104S  [VBP104S]
D603  PLT5 450GB  [PLT5 450GB]
D604  VBP104S  [VBP104S]
R601  1K  [1k 0603]
R602  100R  [100R 0402]
R603  1K  [1k 0603]
R604  100R  [100R 0402]

### Ports
Laser_Cathode_Pin (see Laser_Driver[2C]), Laser_Delay_Cathode_Pin (see Laser_Driver[2B]), PHT_DIOD_+ (see Light_Detection[2C]), PHT_DIOD_DELAY_+ (see Light_Detection[2B])

### Nets
5V: R602.1 R604.2
GND: C601.1 C602.1 C603.1 C604.1 D601.2(CASE) D603.2(CASE)
Vin: R601.2 R603.2
DelayLaserAnode: C601.2 D601.1(ANODE) R601.1
EtalonLaserAnode: C603.2 D603.1(ANODE) R603.1
NetC602_2: C602.2 D602.2(KATODAS) R602.2
NetC604_2: C604.2 D604.2(KATODAS) R604.1
NetD601_3: D601.3(CATHODE) ; port Laser_Delay_Cathode_Pin
NetD602_1: D602.1(ANODAS) ; port PHT_DIOD_DELAY_+
NetD603_3: D603.3(CATHODE) ; port Laser_Cathode_Pin
NetD604_1: D604.1(ANODAS) ; port PHT_DIOD_+

### Notes on the sheet
- @{"Id":"IXTJGDVR\OOGCIWNO","ObjectType":2} @{"Id":"IXTJGDVR\IMMTIYAT","ObjectType":2} ir @{"Id":"IXTJGDVR\VXMRCQUC","ObjectType":2} @{"Id":"IXTJGDVR\VGFMRBMH","ObjectType":2} Talpinė lazerių iškrova
  - @{"Id":"IXTJGDVR\OOGCIWNO","ObjectType":2} / @{"Id":"IXTJGDVR\IMMTIYAT","ObjectType":2} (1k) krauna kondensatorius @{"Id":"IXTJGDVR\VXMRCQUC","ObjectType":2} ir @{"Id":"IXTJGDVR\VGFMRBMH","ObjectType":2} (2nF) iki 9V.
  - Atsidarius GaN tranzistoriui, kondensatorius akimirksniu išsikrauna per lazerį
  ( @{"Id":"IXTJGDVR\VURCQILD","ObjectType":2} / @{"Id":"IXTJGDVR\NUGRJXVH","ObjectType":2} ) į žemę ir duoda aštrų sub-ns šviesos impulsą.
  - Kondensatoriui išsikrovus lazeris užgęsta pats, o 1k varža apsaugo jį nuo sudegimo.
- @{"Id":"IXTJGDVR\XNRLQXHQ","ObjectType":2} @{"Id":"IXTJGDVR\SDPMLDGR","ObjectType":2} ir @{"Id":"IXTJGDVR\HOKUVJCL","ObjectType":2} @{"Id":"IXTJGDVR\BSWCMNJC","ObjectType":2} Fotodiodų priešįtampis
  - @{"Id":"IXTJGDVR\XNRLQXHQ","ObjectType":2} / @{"Id":"IXTJGDVR\HOKUVJCL","ObjectType":2} ir @{"Id":"IXTJGDVR\SDPMLDGR","ObjectType":2} / @{"Id":"IXTJGDVR\BSWCMNJC","ObjectType":2} RC filtrai išvalo 5V maitinimo triukšmus.
  - Katodai pajungti prie 5V, o Anodai per OPA855 (@{"Id":"EQXASDVB\NMYZCVUP","ObjectType":2} ir @{"Id":"EQXASDVB\IJIHGKBT","ObjectType":2}) sėdi ties 3.3V
  (1.7V atbulinis priešįtampis maksimaliai sumažina diodo talpą ir padidina greitį).
  - Šviesos blyksnio srovė siunčiama tiesiai į OPA855 stiprintuvą.
- Title:
- Date:
- Author:
- Sheet:
- Of
- File:

### Library data of the parts
C601 C603 = 2.2nF 0603: C0603X222K1REC7411
C602 C604 = 100n 0402: C1005X7R1E104K050BB
D601 D603 = PLT5 450GB: Lazeris
D602 D604 = VBP104S: FotoDiodas
R601 R603 = 1K 0603: ERA-3AEB102V
R602 R604 = 100R 0402: ERA-2VEB1000X

## Nets that join several sheets
3V3: Power_Supply (15 pins), Time_Delay (12 pins), Light_Detection (12 pins)
5V: Power_Supply (10 pins), Light_Detection (10 pins), Laser_System (R602.1 R604.2)
5VGaN: Power_Supply (5 pins), Laser_Driver (6 pins)
GND: Inputs_Outputs (13 pins), Power_Supply (48 pins), Time_Delay (15 pins), Laser_Driver (18 pins), Light_Detection (24 pins), Laser_System (6 pins)
Vin: Inputs_Outputs (J104.1 J105.1 J109.1), Power_Supply (24 pins), Laser_System (R601.2 R603.2)
NetD601_3: Laser_Driver (Q301.3), Laser_System (D601.3)
NetD602_1: Light_Detection (R503.1), Laser_System (D602.1)
NetD603_3: Laser_Driver (Q302.3), Laser_System (D603.3)
NetD604_1: Light_Detection (R506.1), Laser_System (D604.1)
NetJ101_2: Inputs_Outputs (J101.2), Time_Delay (U403.23)
NetJ101_3: Inputs_Outputs (J101.3), Time_Delay (U403.25)
NetJ101_4: Inputs_Outputs (J101.4), Time_Delay (U403.26)
NetJ101_5: Inputs_Outputs (J101.5), Time_Delay (U403.27)
NetJ101_6: Inputs_Outputs (J101.6), Time_Delay (U403.29)
NetJ101_7: Inputs_Outputs (J101.7), Time_Delay (U403.30)
NetJ101_8: Inputs_Outputs (J101.8), Time_Delay (U403.31)
NetJ101_9: Inputs_Outputs (J101.9), Time_Delay (U403.32)
NetJ101_10: Inputs_Outputs (J101.10), Time_Delay (U403.1)
NetJ101_11: Inputs_Outputs (J101.11), Time_Delay (U403.2)
NetJ102_1: Inputs_Outputs (J102.1), Time_Delay (U401.7)
NetJ103_1: Inputs_Outputs (J103.1), Light_Detection (U502.5)
NetJ107_1: Inputs_Outputs (J107.1), Laser_Driver (R305.2)
NetJ108_1: Inputs_Outputs (J108.1), Light_Detection (U504.5)
NetR302_2: Time_Delay (U402.7), Laser_Driver (R302.2)